# Altium schematic sheet POWER.schdoc
size 297 x 209 mm; Symbol: Drawing-Symbol_A4; Company: 上海道尔汇控智能科技有限公司; Version: V1.2; Page Size: A4; @Project Name: YTM32; @Page Count: 5; @Update Date: 2025-12-28; @Create Date: 2025-10-25; @Schematic Name: YTM32_MotorControl; @Page No: 4; @Page Name: POWER; @Create Time: 03:22:21; @Update Time: 16:22:19; Border: 1; Width: 1170; Height: 825; Region Start: 1; X Region Count: 6; Y Region Count: 4; Blade Width: 10; Title Block Position: 3; @Board Name: YTM32_MotorControl; Device: Drawing-Symbol_A4
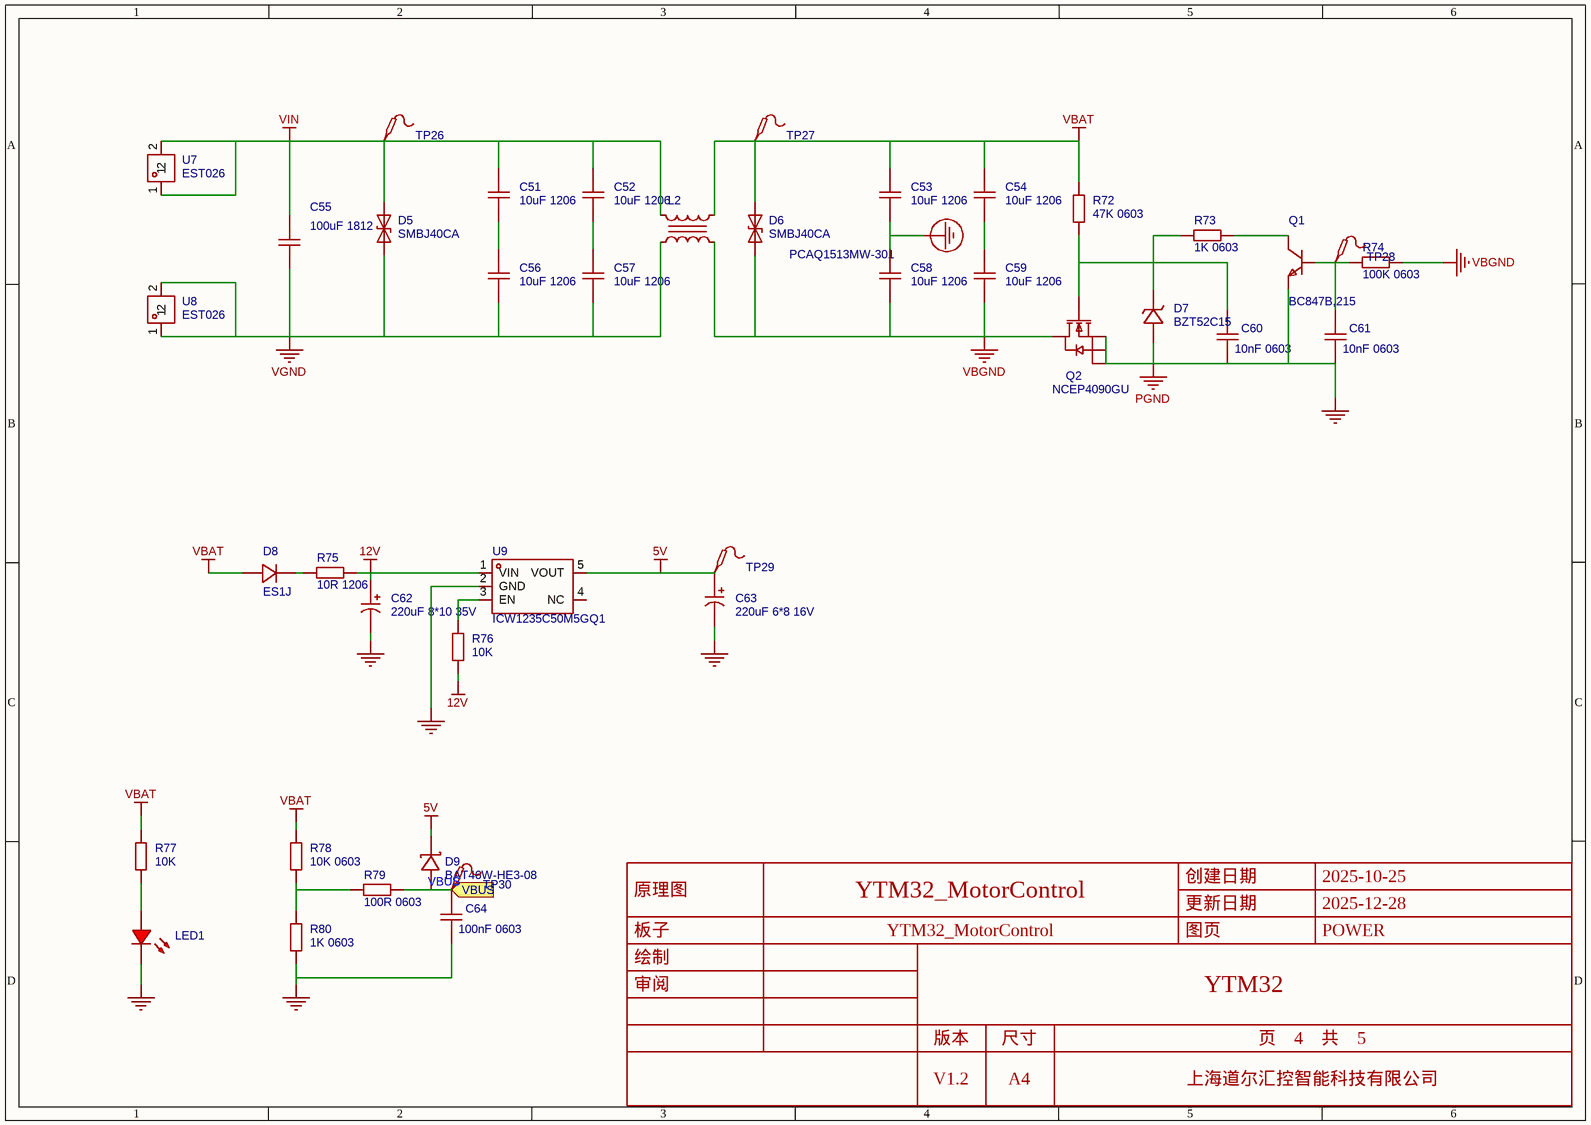
[diagram p0: POWER.schdoc]

## Parts
C51  10uF 1206  [C1206]
C52  10uF 1206  [C1206]
C53  10uF 1206  [C1206]
C54  10uF 1206  [C1206]
C55  100uF 1812  [C1812]
C56  10uF 1206  [C1206]
C57  10uF 1206  [C1206]
C58  10uF 1206  [C1206]
C59  10uF 1206  [C1206]
C60  10nF 0603  [C0603]
C61  10nF 0603  [C0603]
C62  220uF 8*10 35V  [CAP-SMD_BD8.0-L8.3-W8.3-FD]
C63  220uF 6*8 16V  [CAP-SMD_BD6.3-L6.6-W6.6-LS7.3-FD-H7.7]
C64  100nF 0603  [C0603]
D5  SMBJ40CA  [SMB_L4.6-W3.6-LS5.3-BI]
D6  SMBJ40CA  [SMB_L4.6-W3.6-LS5.3-BI]
D7  BZT52C15  [SOD-123_L2.7-W1.6-LS3.7-RD]
D8  ES1J  [SMA_L4.4-W2.8-LS5.4-RD]
D9  BAT46W-HE3-08  [SOD-123_L2.8-W1.8-LS3.7-RD]
L2  PCAQ1513MW-301  [FILTER-SMD_4P-L15.0-W13.0-BL-1]
LED1  (no value)  [LED_0603]
Q1  BC847B,215  [SOT-23-3_L2.9-W1.3-P1.90-LS2.4-BR]
Q2  NCEP4090GU  [POWERVDFN-8_L6.2-W5.2-P1.27-LS6.0-BL]
R72  47K 0603  [R0603]
R73  1K 0603  [R0603]
R74  100K 0603  [R0603]
R75  10R 1206  [R1206]
R76  10K  [R0603]
R77  10K  [R0603]
R78  10K 0603  [R0603]
R79  100R 0603  [R0603]
R80  1K 0603  [R0603]
TP26  (no value)  [Test-Point-0.5mm]
TP27  (no value)  [Test-Point-0.5mm]
TP28  (no value)  [Test-Point-0.5mm]
TP29  (no value)  [Test-Point-0.5mm]
TP30  (no value)  [Test-Point-0.5mm]
U7  EST026  [CONN-TH_L6.3-W0.8-EST026]
U8  EST026  [CONN-TH_L6.3-W0.8-EST026]
U9  ICW1235C50M5GQ1  [SOT-23-5_L2.9-W1.6-P0.95-LS2.8-BR]

## Ports
VBUS (in)

## Nets
5V: C63.1 D9.1(K) TP29.1 U9.5(VOUT)
12V: C62.1 R75.2 R76.2 U9.1(VIN)
EGND: C53.1 C58.2
GND: C60.1 C61.1 C62.2 C63.2 C64.1 D7.2(A) LED1.1(C) Q1.2 Q2.1(S) Q2.2(S) Q2.3(S) R80.1 U9.2(GND)  [also labelled PGND]
VBAT: C53.2 C54.2 D6.2 D8.2(A) L2.4 R72.2 R77.1 R78.2 TP27.1
VBGND: C58.1 C59.1 D6.1 L2.3 Q2.5(D) R74.1
VGND: C55.1 C56.1 C57.1 D5.1 L2.2 U8.1 U8.2
VIN: C51.2 C52.2 C55.2 D5.2 L2.1 TP26.1 U7.1 U7.2
VBUS: C64.2 D9.2(A) R79.1 TP30.1 ; port VBUS
NetC51_1: C51.1 C56.2
NetC52_1: C52.1 C57.2
NetC54_1: C54.1 C59.2
NetC60_2: C60.2 D7.1(K) Q2.4(G) R72.1 R73.2
NetC61_2: C61.2 Q1.1 R74.2 TP28.1
NetD8_1: D8.1(C) R75.1
NetLED1_2: LED1.2(A) R77.2
NetQ1_3: Q1.3 R73.1
NetR76_1: R76.1 U9.3(EN)
NetR78_1: R78.1 R79.2 R80.2

Not connected (* = marked no-connect by the designer): U9 4(NC)

## Notes on the sheet
- 创建日期
- 2025-10-25
- 原理图
- 板子
- YTM32_MotorControl
- 更新日期
- 图页
- 2025-12-28
- POWER
- 绘制
- 审阅
- YTM32
- 版本
- V1.2
- 尺寸
- A4
- 页    4    共    5
- 上海道尔汇控智能科技有限公司

## Library data of the parts
C51-C54 C56-C59 = CAP_1206: ConvertToPcb: yes; SymbolName: CapAcitance; ModelId: e4be705b945545a48e666415e3682bd8; ModelName: C1206_L3.2-W1.6-H1.3; ModelTransform: 125.984,62.992,0,0,0,0,0,0,0; Value: 10uF 1206; Device: CAP_1206; AddInBom: yes; Supplier Footprint: 1206; FootprintName: C1206
C55 = C4532X5R1A107MT000E: 容值:100uF;精度:±20%;额定电压:10V;温度系数:X5R;; Manufacturer: TDK; AddInBom: yes; ModelId: 654205cbd64044c4b833fe7af5979bc9; ModelName: C1812_L4.5-W3.2-H2.6; ModelTransform: 177.165,125.984,0,0,0,0,0.0005,0,0; Tolerance: ±20%; Voltage Rating: 10V; Temperature Coefficient: X5R; Symbol: C4532X5R1A107MT000E; Value: 100uF 1812; Device: C4532X5R1A107MT000E; LCSC Part Name: 100uF ±20% 10V; ManufacturerPart: C4532X5R1A107MT000E; Supplier Footprint: 1812; JLCPCB Part Class: 扩展库; Datasheet: https://item.szlcsc.com/datasheet/C4532X5R1A107MT000E/319453.html; Supplier: LCSC; ConvertToPcb: yes; FootprintName: C1812
C60 C61 C64 = CAP_0603: ConvertToPcb: yes; SymbolName: CapAcitance; ModelId: ac125912035d415993ca9572d50418b1; ModelName: C0603_L1.6-W0.8-H0.8; ModelTransform: 62.992,31.496,0,0,0,0,0,0,0; Device: CAP_0603; AddInBom: yes; Supplier Footprint: 0603; FootprintName: C0603
  C60 C61: Value: 10nF 0603
  C64: Value: 100nF 0603
C62 = GVT1V227M0810CNVC: 容值:220uF;精度:±20%;额定电压:35V;纹波电流:175mA@120Hz;; Manufacturer: HRK(鸿瑞凯电子); AddInBom: yes; ModelId: 5c9301d64f8b45ea89e061ac72e6cbf7; ModelTransform: 393.7,326.771,0,180,0,0,0,0,0; Tolerance: ±20%; φD: 8mm; L: 10.5mm; Lifetime @ Temp: 2000hrs@105℃; Symbol: GVT1V227M0810CNVC; Value: 220uF 8*10 35V; Device: GVT1V227M0810CNVC; LCSC Part Name: 220uF ±20% 35V; ManufacturerPart: GVT1V227M0810CNVC; Supplier Footprint: SMD,D8xL10.5mm; JLCPCB Part Class: 扩展库; Datasheet: https://atta.szlcsc.com/upload/public/pdf/source/20220321/BA17E910A44EA2B508CDD6AB8BA576BA.pdf; Supplier: LCSC; ConvertToPcb: yes; FootprintName: CAP-SMD_BD8.0-L8.3-W8.3-FD; ModelName: CAP-SMD_BD8.0-L8.3-W8.3-FD; Rated Voltage: 35V; Ripple Current: 175mA@120Hz; Operating Temperature: -55℃~+105℃
C63 = JVJ25V220M6x8: 容值:220uF;精度:±20%;额定电压:25V;纹波电流:120mA@120Hz;; Manufacturer: JIERR(捷而瑞); AddInBom: yes; ModelId: ccbda52dceed4b139172c40f75c9da3f; ModelTransform: 287.401,259.842,0,0,0,0,0,0,0; Tolerance: ±20%; Voltage Rating: 25V; Lifetime: 2000hrs@105℃; Symbol: JVJ25V220M6X8; Value: 220uF 6*8 16V; Device: JVJ25V220M6x8; LCSC Part Name: 220uF ±20% 25V; ManufacturerPart: JVJ25V220M6x8; Supplier Footprint: SMD,D6.3xL7.7mm; JLCPCB Part Class: 扩展库; Datasheet: https://item.szlcsc.com/datasheet/JVJ25V220M6x8/48680098.html; Supplier: LCSC; ConvertToPcb: yes; FootprintName: CAP-SMD_BD6.3-L6.6-W6.6-LS7.3-FD-H7.7; ModelName: CAP-SMD_BD6.3-L6.6-W6.6-LS7.3-FD-H7.7; Ripple Current: 120mA@120Hz; Diameter: 6.3mm; Height - Seated (Max): 7.7mm; Operating Temperature: -55℃~+105℃
D5 D6 = SMBJ40CA_C84730: 极性:双向;反向截止电压(Vrwm):40V;钳位电压:64.5V;峰值脉冲电流(Ipp):9.3A;峰值脉冲功率(Ppp):600W@10/1000us;击穿电压:44.4V;; Manufacturer: Brightking(君耀电子); Symbol: SMBJ40CA-C84730; AddInBom: yes; ModelId: 07b8d28694b84373acb83e050c4644c9; ModelTransform: 212.598,141.732,0,0,0,0,0,0,0; Polarity: 双向; Reverse Stand-Off Voltage (Vrwm): 40V; Clamping Voltage: 64.5V; Peak Pulse Current (Ipp): 9.3A; Voltage - Breakdown: 44.4V; Reverse Leakage Current (Ir): 1uA; Type: TVS; Device: SMBJ40CA_C84730; LCSC Part Name: 双向TVS 40V截止 峰值脉冲电流：9.3A; SupplierPart: C84730; ManufacturerPart: SMBJ40CA; Supplier Footprint: SMB(DO-214AA); JLCPCB Part Class: 扩展库; Datasheet: https://item.szlcsc.com/datasheet/SMBJ40CA/85901.html; Supplier: LCSC; ConvertToPcb: yes; FootprintName: SMB_L4.6-W3.6-LS5.3-BI; ModelName: SMB_L4.6-W3.6-LS5.3-BI; Peak Pulse Power Dissipation (Ppp): 600W@10/1000us
D7 = BZT52C5V1_C19077401: 二极管配置:独立式;稳压值(标称值):5.1V;稳压值(范围):4.85V~5.36V;耗散功率(Pd):350mW;; Manufacturer: R+O(宏嘉诚); AddInBom: yes; ModelId: ad7e39f9e5534b3c96ffdc5532ebb493; ModelName: SOD-123_L2.7-W1.6-H1.4-LS3.7; ModelTransform: 146.026,62.992,0,180,0,0,0.0005,0,0; Diode Configuration: 独立式; Zener Voltage(Nom): 5.1V; Reverse Leakage Current (Ir): 2uA; Pd - Power Dissipation: 350mW; Impedance(Zzt): 60Ω; Impedance(Zzk): 480Ω; Operating Junction Temperature Range: -55℃~+150℃; Symbol: BZT52C5V1_C19077401; Manufacturer Part: BZT52C15; Device: BZT52C5V1_C19077401; LCSC Part Name: 表面贴装齐纳二极管; SupplierPart: C19077401; Supplier Footprint: SOD-123; JLCPCB Part Class: 扩展库; Datasheet: https://item.szlcsc.com/datasheet/BZT52C5V1/20275486.html; Supplier: LCSC; ConvertToPcb: yes; FootprintName: SOD-123_L2.7-W1.6-LS3.7-RD; Zener Voltage(Range): 4.85V~5.36V
D8 = ES1J_C412438: 二极管配置:独立式;正向压降(Vf):1.7V@1A;直流反向耐压(Vr):600V;整流电流:1A;反向恢复时间(Trr):35ns;; Manufacturer: MDD(辰达半导体); Symbol: ES1JG_C412438; AddInBom: yes; ModelId: 4f1e9ef2303f48b48aa8ce0cacf8d7b1; ModelTransform: 204.724,102.362,0,0,0,0,0,0,0; Diode Configuration: 独立式; Voltage - DC Reverse(Vr): 600V; Current - Rectified: 1A; Reverse Leakage Current (Ir): 5uA@600V; Reverse Recovery Time (trr): 35ns; Operating Junction Temperature Range: -55℃~+150℃@(Tj); Device: ES1J_C412438; LCSC Part Name: 耐压:600V 电流:1A 反向恢复时间：35ns; SupplierPart: C412438; ManufacturerPart: ES1J; Supplier Footprint: SMA; JLCPCB Part Class: 扩展库; Datasheet: https://item.szlcsc.com/datasheet/ES1J/404261.html; Supplier: LCSC; ConvertToPcb: yes; FootprintName: SMA_L4.4-W2.8-LS5.4-RD; ModelName: SMA_L4.4-W2.8-LS5.4-RD; Voltage - Forward(Vf@If): 1.7V@1A
D9 = BAT46W-HE3-08: 二极管配置:1个独立式;正向压降(Vf):1V@250mA;直流反向耐压(Vr):100V;整流电流:150mA;; Manufacturer: VISHAY(威世); AddInBom: yes; ModelId: 7884390a25fb4c08947731ebfba7e3f8; ModelTransform: 144.8816,62.992,0,0,0,0,0,0,0; Diode Configuration: 1个独立式; Voltage - DC Reverse(Vr): 100V; Current - Rectified: 150mA; Reverse Leakage Current (Ir): 5uA@75V; Non-Repetitive Peak Forward Surge Current: 750mA; Symbol: BAT46W-HE3-08; Device: BAT46W-HE3-08; LCSC Part Name: 停产 电压:100V 电流:150mA; SupplierPart: C145279; ManufacturerPart: BAT46W-HE3-08; Supplier Footprint: SOD-123; JLCPCB Part Class: 扩展库; Datasheet: https://item.szlcsc.com/datasheet/BAT46W-HE3-08/156611.html; Supplier: LCSC; ConvertToPcb: yes; FootprintName: SOD-123_L2.8-W1.8-LS3.7-RD; ModelName: SOD-123_L2.8-W1.8-LS3.7-RD; Voltage - Forward(Vf@If): 1V@250mA
L2 = PCAQ1513MW-301: 通道数:2;阻抗@频率:300Ω@100MHz;直流电阻(DCR):6mΩ;; Manufacturer: PROD(谱罗德); AddInBom: yes; ModelId: b7d4aa24894142bebd21e640747a476a; ModelTransform: 511.81,590.55,0,90,0,0,-0.004,0.003,0; Number of Lines: 2; Current Rating: 13A; Voltage Rating - DC: 125V; DC Resistance(DCR): 6mΩ; Insulation Resistance(IR): 10MΩ; Symbol: PCAQ1513MW-301; Device: PCAQ1513MW-301; LCSC Part Name: 两路 贴片共模滤波器 阻抗300Ω@100MHz; SupplierPart: C2916880; ManufacturerPart: PCAQ1513MW-301; Supplier Footprint: SMD-4P,15x13mm; JLCPCB Part Class: 扩展库; Datasheet: https://item.szlcsc.com/datasheet/PCAQ1513MW-301/3213201.html; Supplier: LCSC; ConvertToPcb: yes; FootprintName: FILTER-SMD_4P-L15.0-W13.0-BL-1; ModelName: FILTER-SMD_4P-L15.0-W13.0-BL-1; Voltage Withstand: -; Voltage Rating (AC): 125V; Impedance @ Frequency: 300Ω@100MHz; Operating Temperature: -25℃~+125℃
LED1 = LED_0603-R: Symbol: LED_R; Convert to PCB: yes; 3D Model: dd8257b0d61a4cd7b68939a056e08095; 3D Model Transform: 58.72,29.4,22.03,0,0,0,0,0,0; ModelName: LED-0603_R; Device: LED_0603-R; Add into BOM: yes; Supplier Footprint: 0603; FootprintName: LED_0603
Q1 = BC847B,215: 晶体管类型:NPN;集电极电流(Ic):100mA;集射极击穿电压(Vceo):45V;功率(Pd):250mW;直流电流增益(hFE@Ic,Vce):200@2mA,5V;; Manufacturer: Nexperia(安世); AddInBom: yes; ModelId: c62791f0466c4ae2a892c056b845b0ca; ModelName: SOT-23-3P_L2.9-W1.3-H1.0-LS2.4-P0.95; ModelTransform: 98.425,114.173,0,180,0,0,0.0005,-0.0005,0; Transistor Type: NPN; Collector Current (Ic): 100mA; Collector-Emitter Breakdown Voltage (Vceo): 45V; Power Dissipation (Pd): 250mW; Transition Frequency (fT): 100MHz; Collector Cut-Off Current (Icbo): 5uA; Collector-Emitter Saturation Voltage (VCE(sat)@Ic,Ib): 200mV@100mA,5mA; Symbol: BC847B,215; Device: BC847B,215; LCSC Part Name: NPN 电流:100mA 耐压:45V hfe=200~450; SupplierPart: C57668; ManufacturerPart: BC847B,215; Supplier Footprint: SOT-23; JLCPCB Part Class: 扩展库; Datasheet: https://atta.szlcsc.com/upload/public/pdf/source/20230809/3408F6A472B40CAE49D6B736987AA441.pdf; Supplier: LCSC; ConvertToPcb: yes; FootprintName: SOT-23-3_L2.9-W1.3-P1.90-LS2.4-BR; DC Current Gain (hFE@Ic,Vce): 200@2mA,5V; Operating Temperature: -65℃~+150℃
Q2 = JMSH0401AGQ_C7527437: 数量:1个N沟道;漏源电压(Vdss):40V;连续漏极电流(Id):197A;导通电阻(RDS(on)):1.3mΩ@10V;耗散功率(Pd):136W;阈值电压(Vgs(th)):2.8V;; Manufacturer: JJW(捷捷微); AddInBom: yes; ModelId: 68f5081a2b0f40dd8e3b8f153db072c6; ModelName: POWERVDFN-8_L5.8-W4.9-H1.0-P1.27; ModelTransform: 229.1334,193.7004,0,90,0,0,-0.001,36.413,0; Number: 1个N沟道; Drain to Source Voltage: 40V; Current - Continuous Drain(Id): 197A; Pd - Power Dissipation: 136W; Gate Threshold Voltage (Vgs(th)): 2.8V; Gate Charge(Qg): 42nC@10V; Input Capacitance(Ciss): 3.015nF; Reverse Transfer Capacitance (Crss@Vds): 18pF; Output Capacitance(Coss): 2nF; Symbol: JMSH0401AGQ_C7527437; Manufacturer Part: NCEP4090GU; Device: JMSH0401AGQ_C7527437; LCSC Part Name: 40V N沟道功率MOSFET; SupplierPart: C7527437; Supplier Footprint: DFN-8(5x6); JLCPCB Part Class: 扩展库; Datasheet: https://item.szlcsc.com/datasheet/JMSH0401AGQ/8622041.html; Supplier: LCSC; ConvertToPcb: yes; FootprintName: POWERVDFN-8_L6.2-W5.2-P1.27-LS6.0-BL; RDS(on): 1.3mΩ@10V
R72-R74 R76-R80 = Res_0603: Symbol: 电阻; ConvertToPcb: yes; ModelId: fc143cca1e79419f9cd78b61e9279f08; ModelTransform: 31.8897,63.7794,0,90,0,0,0,0,0; Device: Res_0603; AddInBom: yes; Supplier Footprint: 0603; FootprintName: R0603; ModelName: R0603
  R72: Value: 47K 0603
  R73 R80: Value: 1K 0603
  R74: Value: 100K 0603
  R76 R77: Value: 10K
  R78: Value: 10K 0603
  R79: Value: 100R 0603
R75 = Res_1206: AddInBom: yes; SymbolName: 电阻; ModelId: 89a1f13db2384da588040e0b3c55bf66; ModelName: R1206_L3.2-W1.6-H0.6; ModelTransform: 125.984,62.992,0,0,0,0,0,0,0; Value: 10R 1206; Device: Res_1206; Supplier Footprint: 1206; ConvertToPcb: yes; FootprintName: R1206
TP26-TP30 = Test-Point: Test Point 测试点; AddInBom: yes; Device: Test-Point; ConvertToPcb: yes; SymbolName: Test-Point; FootprintName: Test-Point-0.5mm
U7 U8 = EST026: 环保; Manufacturer: xcfuse(旭程); AddInBom: yes; ModelId: caeb915258b34f389ee2048176497ca2; ModelTransform: 328.7395,78.74,0,0,0,0,0,0,-137.795; Symbol: EST026; Device: EST026; LCSC Part Name: EST026; SupplierPart: C52878; ManufacturerPart: EST026; Supplier Footprint: 插件; JLCPCB Part Class: 扩展库; Datasheet: https://item.szlcsc.com/datasheet/EST026/53893.html; Supplier: LCSC; ConvertToPcb: yes; FootprintName: CONN-TH_L6.3-W0.8-EST026; ModelName: CONN-TH_L6.3-W0.8-EST026
U9 = ICW1235C50M5GQ1: 输出类型:固定;工作电压:40V;输出电压:5V;输出电流:200mA;电源纹波抑制比(PSRR):-;输出极性:正极;; Manufacturer: ICW(艾创微); AddInBom: yes; ModelId: 7ba65df16e7b4570af156e925f9c37fe; ModelTransform: 114.173,114.173,0,90,0,0,0,0,0; Output Type: 固定; Voltage - Supply: 40V; Output Voltage: 5V; Output Current: 200mA; standby current: 1.5uA; Output Configuration: 正极; Number of Outputs: 1; Symbol: ICW1235C50M5GQ1; Device: ICW1235C50M5GQ1; LCSC Part Name: 车规级40V耐压、低功耗、高精度LDO转换器; SupplierPart: C5448737; ManufacturerPart: ICW1235C50M5GQ1; Supplier Footprint: SOT23-5; JLCPCB Part Class: 扩展库; Datasheet: https://item.szlcsc.com/datasheet/ICW1235C50M5GQ1/6350612.html; Supplier: LCSC; ConvertToPcb: yes; FootprintName: SOT-23-5_L2.9-W1.6-P0.95-LS2.8-BR; ModelName: SOT-23-5_L2.9-W1.6-P0.95-LS2.8-BR; Power Supply Rejection Ratio (PSRR): -; Features: 过热保护；过流保护; Operating Temperature: -40℃~+125℃@(Ta)